# Altium project EKG.PrjPcb
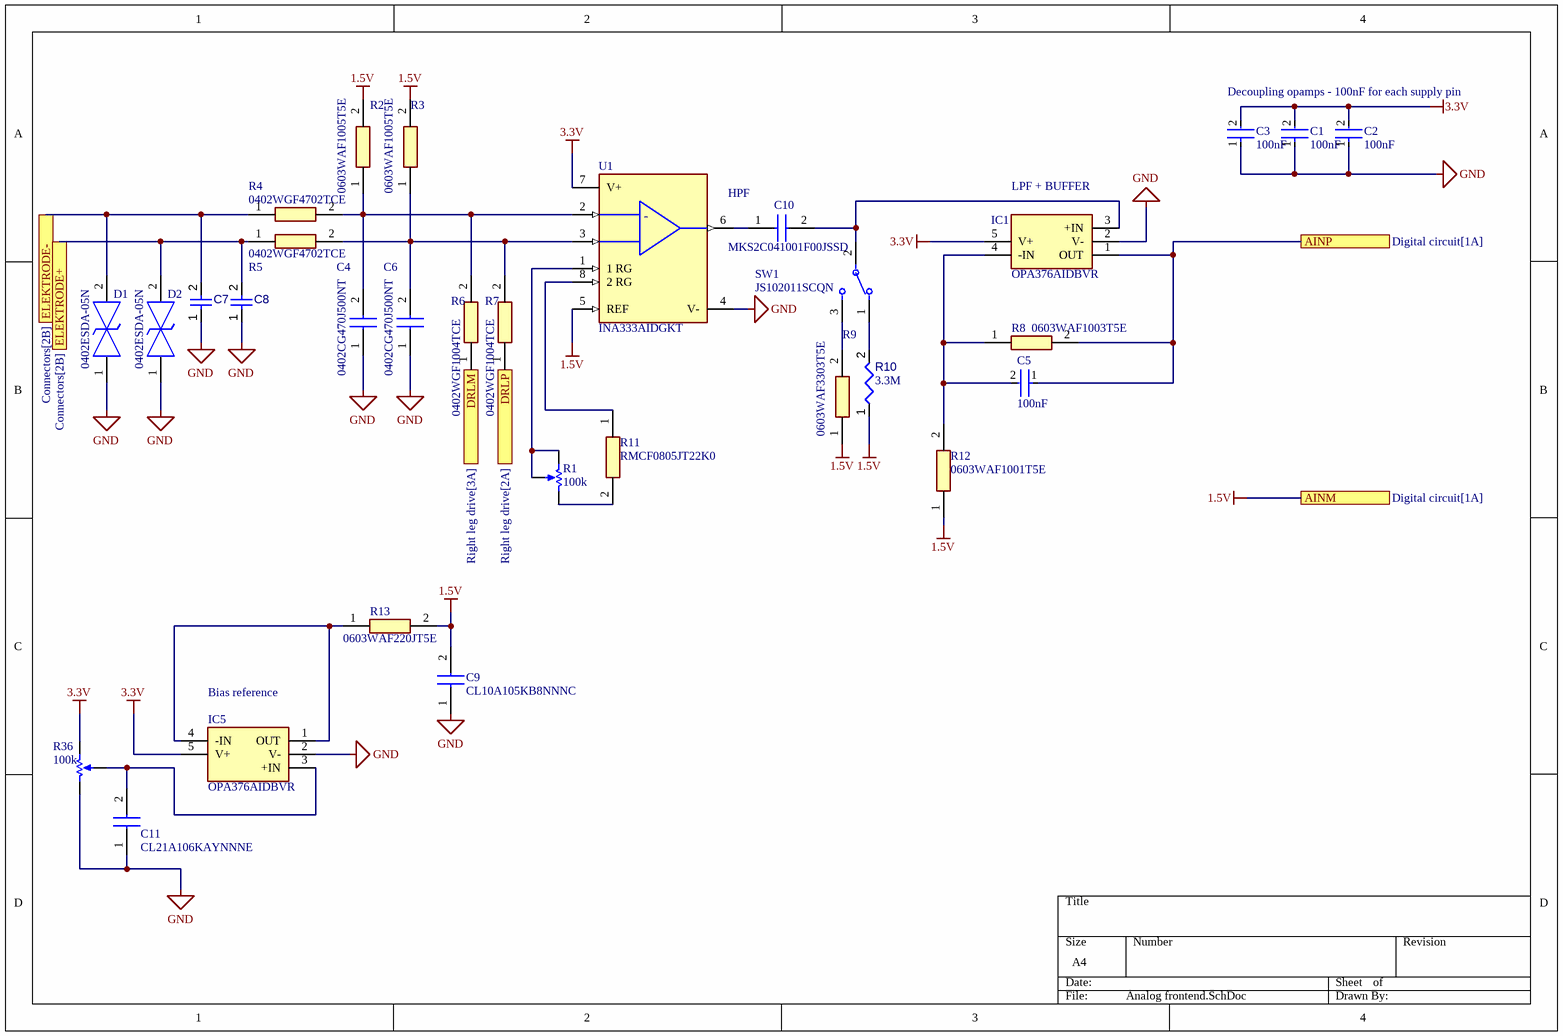
[diagram p0: Analog frontend.SchDoc]
5 sheets, 78 parts. Net scope: flat (ports and power ports of the same name join across sheets).
Board file: PCB.PcbDoc
Sheets:
  Analog frontend.SchDoc
  Digital circuit.SchDoc
  Power supply.SchDoc
  Right leg drive.SchDoc
  Connectors.SchDoc

## Sheet Analog frontend.SchDoc: Analog ECG Frontend
size A4; SheetNumber: 1; SheetTotal: 5

### Parts
C1  value 100nF  [FP-CC0603-DA-IPC_B]  (hidden comment: CC0603KRX7R9BB104)
C2  value 100nF  [FP-CC0603-DA-IPC_B]  (hidden comment: CC0603KRX7R9BB104)
C3  value 100nF  [FP-CC0603-DA-IPC_B]  (hidden comment: CC0603KRX7R9BB104)
C4  0402CG470J500NT  [CAPC1005X55N]
C5  value 100nF  [FP-CC0603-DA-IPC_B]  (hidden comment: CC0603KRX7R9BB104)
C6  0402CG470J500NT  [CAPC1005X55N]
C7  TCC0402COG220J500AT  [TCC0402COG220J500AT]  (value not drawn)
C8  TCC0402COG220J500AT  [TCC0402COG220J500AT]  (value not drawn)
C9  CL10A105KB8NNNC  [CAPC1608X90N]
C10  MKS2C041001F00JSSD  [MKS2C041001F00JSSD]
C11  CL21A106KAYNNNE  [CAPC2012X145N]
D1  0402ESDA-05N  [DIONC1005X60N]
D2  0402ESDA-05N  [DIONC1005X60N]
IC1  OPA376AIDBVR  [SOT95P280X145-5N]
IC5  OPA376AIDBVR  [SOT95P280X145-5N]
R1  value 100k  [BOUR-3266W-3_V]  (hidden comment: 3266W-1-104LF)
R2  0603WAF1005T5E  [RESC1608X55N]
R3  0603WAF1005T5E  [RESC1608X55N]
R4  0402WGF4702TCE  [RESC1005X40N]
R5  0402WGF4702TCE  [RESC1005X40N]
R6  0402WGF1004TCE  [RESC1005X40N]
R7  0402WGF1004TCE  [RESC1005X40N]
R8  0603WAF1003T5E  [RESC1608X55N]
R9  0603WAF3303T5E  [RESC1608X55N]
R10  value 3.3M  [0603WAF3304T5E]  (hidden comment: 0603WAF3304T5E)
R11  RMCF0805JT22K0  [RESC2012X65N]
R12  0603WAF1001T5E  [RESC1608X55N]
R13  0603WAF220JT5E  [RESC1608X55N]
R36  value 100k  [BOUR-3266W-3_V]  (hidden comment: 3266W-1-104LF)
SW1  JS102011SCQN  [FP-JS102011SCQN-MFG]
U1  INA333AIDGKT  [FP-DGK0008A-IPC_B]

### Ports
AINM (see Digital circuit[1A]), AINP (see Digital circuit[1A]), DRLM (see Right leg drive[3A]), DRLP (see Right leg drive[2A]), ELEKTRODE+ (see Connectors[2B]), ELEKTRODE- (see Connectors[2B])

### Nets
1.5V: C9.2 R2.2 R3.2 R9.1 R10.1 R12.1 R13.2 U1.5(REF) ; port AINM
3.3V: C1.2 C2.2 C3.2 IC1.5(V+) IC5.5(V+) R36.1(CCW) U1.7(V+)
GND: C1.1 C2.1 C3.1 C4.1 C6.1 C7.1 C8.1 C9.1 C11.1 D1.1 D2.1 IC1.2(V-) IC5.2(V-) R36.3(CW) U1.4(V-)
NetC4_2: C4.2 R2.1 R4.2 R6.2 U1.2(VIN-)
NetC5_1: C5.1 IC1.1(OUT) R8.2 ; port AINP
NetC5_2: C5.2 IC1.4(-IN) R8.1 R12.2
NetC6_2: C6.2 R3.1 R5.2 R7.2 U1.3(VIN+)
NetC7_2: C7.2 D1.2 R4.1 ; port ELEKTRODE-
NetC8_2: C8.2 D2.2 R5.1 ; port ELEKTRODE+
NetC10_1: C10.1 U1.6(VOUT)
NetC10_2: C10.2 IC1.3(+IN) SW1.2(C)
NetC11_2: C11.2 IC5.3(+IN) R36.2(WIPER)
NetIC2_3: R7.1 ; port DRLP
NetIC3_3: R6.1 ; port DRLM
NetIC5_1: IC5.1(OUT) IC5.4(-IN) R13.1
NetR1_1: R1.1(CCW) R11.2
NetR1_2: R1.2(WIPER) R1.3(CW) U1.1(1_RG)
NetR9_2: R9.2 SW1.3
NetR10_2: R10.2 SW1.1
NetR11_1: R11.1 U1.8(2_RG)

### Notes on the sheet
- Decoupling opamps - 100nF for each supply pin
- (near U1) HPF
- (near IC1) LPF + BUFFER
- (near IC5) Bias reference
- (in symbol CMP-014-00006-1) -

### Library data of the parts
C1-C3 C5 = CMP-001-00148-1: Multilayer Ceramic Capacitor, CC Series, 0.1 - F, - 10%, X7R, 50 V, 0603 [1608 Metric]; Voltage Rating: 50V; Mounting Technology: Surface Mount; Tolerance: 10%; Case/Package: 0603; Max Operating Temperature: 125°C; Min Operating Temperature: -55°C; Pins: 2; Lead Free: Lead Free; Case Code (Metric): 1608; Width: 800µm; Termination: SMD/SMT; Depth: 800µm; RoHS: Compliant; Material: Ceramic; Dielectric: X7R; Schedule B: 8532240020, 8532240020; Country of Origin: Mainland China, Taiwan; Lifecycle Status: Production; Radiation Hardening: No; Case Code (Imperial): 0603; Height: 800µm; Number of Terminals: 2; China RoHS: Compliant; Voltage Rating (DC): 50V; Export Control Classification Number (ECCN) Code: EAR99; Halogen Free: Halogen Free; Thickness: 889µm; Voltage: 50V; Length: 1.6mm; Harmonized Tariff Schedule (HTS) Code: 8532.24.00.20; REACH SVHC: Unaffected; Introduction Date: 2005-08-18; Dielectric Material: Ceramic
C4 C6 = 0402CG470J500NT: Capacitor; Manufacturer_Name: Guangdong Fenghua Advanced Tech; Datasheet Link: https://datasheet.lcsc.com/szlcsc/Guangdong-Fenghua-Advanced-Tech-0402CG470J500NT_C1567.pdf; Height: 0.55mm; Manufacturer_Part_Number: 0402CG470J500NT
C7 C8 = CMP-001-00152-1: 50V 22pF C0G ±5% 0402 Multilayer Ceramic Capacitors MLCC - SMD/SMT ROHS
C9 = CL10A105KB8NNNC: Capacitor; Manufacturer_Name: SAMSUNG; Datasheet Link: https://datasheet.datasheetarchive.com/originals/distributors/Datasheets-DGA10/2411562.pdf; Height: 0.9mm; Manufacturer_Part_Number: CL10A105KB8NNNC; Mouser Part Number: 187-CL10A105KB8NNNC; Mouser Price/Stock: https://www.mouser.co.uk/ProductDetail/Samsung-Electro-Mechanics/CL10A105KB8NNNC?qs=ktYoCbbtCSJz4pFCLWXd5g%3D%3D; Arrow Part Number: CL10A105KB8NNNC; Arrow Price/Stock: https://www.arrow.com/en/products/cl10a105kb8nnnc/samsung-electro-mechanics.html?utm_currency=USD&region=nac
C10 = MKS2C041001F00JSSD: Capacitor; Manufacturer_Name: WIMA; Datasheet Link: https://www.digikey.com/en/products/detail/wima/MKS2C041001F00JSSD/19251598; Height: 10mm; Manufacturer_Part_Number: MKS2C041001F00JSSD; Mouser Part Number: 505-MKS21.0/63/5; Mouser Price/Stock: https://www.mouser.co.uk/ProductDetail/WIMA/MKS2C041001F00JSSD?qs=ISKKXg98%252B1lQgUuGZjf9mQ%3D%3D; Arrow Part Number: MKS2C041001F00JSSD; Arrow Price/Stock: https://www.arrow.com/en/products/mks2c041001f00jssd/wima?region=europe
C11 = CL21A106KAYNNNE: Capacitor; Manufacturer_Name: SAMSUNG; Datasheet Link: https://datasheet.datasheetarchive.com/originals/distributors/Datasheets_SAMA/6a45835c9b7400e9b49c55c38a8ff4a2.pdf; Height: 1.45mm; Manufacturer_Part_Number: CL21A106KAYNNNE; Mouser Part Number: 187-CL21A106KAYNNNE; Mouser Price/Stock: https://www.mouser.co.uk/ProductDetail/Samsung-Electro-Mechanics/CL21A106KAYNNNE?qs=yOVawPpwOwmTXAd4dJtNjA%3D%3D; Arrow Part Number: CL21A106KAYNNNE; Arrow Price/Stock: https://www.arrow.com/en/products/cl21a106kaynnne/samsung-electro-mechanics.html?utm_currency=USD&region=nac
D1 D2 = 0402ESDA-05N: TVS Diode (Bi-directional); Manufacturer_Name: Bourne Semicon; Datasheet Link: https://datasheet.lcsc.com/szlcsc/1811061308_Bourne-Semicon-Shenzhen-0402ESDA-05N_C316049.pdf; Height: 0.6mm; Manufacturer_Part_Number: 0402ESDA-05N
IC1 IC5 = OPA376AIDBVR: Integrated Circuit; Manufacturer_Name: Texas Instruments; Datasheet Link: http://www.ti.com/lit/gpn/OPA376; Height: 1.45mm; Manufacturer_Part_Number: OPA376AIDBVR; Mouser Part Number: 595-OPA376AIDBVR; Mouser Price/Stock: https://www.mouser.co.uk/ProductDetail/Texas-Instruments/OPA376AIDBVR?qs=xL7PkI2RoJ57GVtJklM7uw%3D%3D; Arrow Part Number: OPA376AIDBVR; Arrow Price/Stock: https://www.arrow.com/en/products/opa376aidbvr/texas-instruments.html?utm_currency=USD&region=europe
R1 R36 = CMP-009-00233-1: Trimmer, Cermet, Rest 100 Kilohms, Pcb, Pwr-rtg 0.25W, Dim 0.264INLX0.177INWX0.285INH; Insulation Resistance: 1GΩ; Lead Length: 4.88mm; Lead Diameter: 460µm; Voltage Rating: 300V; Max Power Dissipation: 250mW; Pitch: 2.54mm; Number of Turns: 12; Tolerance: 10%; Temperature Coefficient: 100ppm/°C; Composition: Cermet; Number of Terminals: 3; Military Standard: Not; REACH SVHC: Affected; Thickness: 5.59mm; Taper: Linear; Max Operating Temperature: 125°C; Contact Plating: Tin; Depth: 4.5mm; RoHS: Compliant; Min Operating Temperature: -55°C; Pins: 3; Termination: Pin; Height: 7.24mm; Schedule B: 8533400080, 8533400080; Working Voltage: 300V; Voltage Rating (AC): 300V; Voltage Rating (DC): 300V; Width: 4.5mm; Radiation Hardening: No; Lifecycle Status: Production; Weight: 425.242847mg; Type: Potentiometer; Color: Blue; Length: 6.71mm; Power Rating: 250mW
R2 R3 = 0603WAF1005T5E: Resistor; Manufacturer_Name: ROYALOHM; Datasheet Link: https://eu.mouser.com/datasheet/3/5925/1/1.pdf; Height: 0.55mm; Manufacturer_Part_Number: 0603WAF1005T5E; Mouser Part Number: 303-0603WAF1005T5E; Mouser Price/Stock: https://www.mouser.co.uk/ProductDetail/Royalohm/0603WAF1005T5E?qs=e8oIoAS2J1TtIpBlPWLC5w%3D%3D
R4 R5 = 0402WGF4702TCE: Resistor; Manufacturer_Name: UNI-ROYAL(Uniroyal Elec); Datasheet Link: https://datasheet.lcsc.com/szlcsc/Uniroyal-Elec-0402WGF4702TCE_C25792.pdf; Height: 0.4mm; Manufacturer_Part_Number: 0402WGF4702TCE
R6 R7 = 0402WGF1004TCE: Resistor; Manufacturer_Name: ROYALOHM; Datasheet Link: https://www.mouser.ca/datasheet/2/1365/1-3044649.pdf; Height: 0.4mm; Manufacturer_Part_Number: 0402WGF1004TCE; Mouser Part Number: 303-0402WGF1004TCE; Mouser Price/Stock: https://www.mouser.co.uk/ProductDetail/Royalohm/0402WGF1004TCE?qs=e8oIoAS2J1Sm8qYhjADD%252Bg%3D%3D
R8 = 0603WAF1003T5E: Resistor; Manufacturer_Name: UNI-ROYAL(Uniroyal Elec); Datasheet Link: https://datasheet.lcsc.com/szlcsc/Uniroyal-Elec-0603WAF1003T5E_C25803.pdf; Height: 0.55mm; Manufacturer_Part_Number: 0603WAF1003T5E
R9 = 0603WAF3303T5E: Resistor; Manufacturer_Name: Uniroyal Elec; Datasheet Link: https://datasheet.lcsc.com/szlcsc/Uniroyal-Elec-0603WAF3303T5E_C23137.pdf; Height: 0.55mm; Manufacturer_Part_Number: 0603WAF3303T5E
R10 = CMP-009-00239-1: Res Thick Film 0603 3.3M Ohm 1% 0.1W(1/10W) ±100ppm/C Pad SMD T/R; Working Voltage: 75V; Power Rating: 100mW; Temperature Coefficient: 100ppm/°C; Lifecycle Status: Production; REACH SVHC: Unaffected; Case/Package: 0603; Number of Terminals: 2; Mounting Technology: Surface Mount; Width: 800µm; RoHS: Compliant; China RoHS: Non-Compliant; Length: 1.6mm; Tolerance: 1%; Max Operating Temperature: 155°C; Height: 450µm; Min Operating Temperature: -55°C
R11 = RMCF0805JT22K0: Resistor; Manufacturer_Name: Stackpole Electronics; Datasheet Link: https://cs.seielect.com/catalog/SEI-RMCF_RMCP.pdf; Height: 0.65mm; Manufacturer_Part_Number: RMCF0805JT22K0; Mouser Part Number: 708-RMCF0805JT22K0; Mouser Price/Stock: https://www.mouser.co.uk/ProductDetail/SEI-Stackpole/RMCF0805JT22K0?qs=FESYatJ8odJj8AR7KQYlug%3D%3D; Arrow Part Number: RMCF0805JT22K0; Arrow Price/Stock: https://www.arrow.com/en/products/rmcf0805jt22k0/stackpole-electronics?region=nac
R12 = 0603WAF1001T5E: Resistor; Manufacturer_Name: UNI-ROYAL(Uniroyal Elec); Datasheet Link: https://datasheet.lcsc.com/szlcsc/Uniroyal-Elec-0603WAF1001T5E_C21190.pdf; Height: 0.55mm; Manufacturer_Part_Number: 0603WAF1001T5E
R13 = 0603WAF220JT5E: Resistor; Manufacturer_Name: UNI-ROYAL(Uniroyal Elec); Datasheet Link: https://www.lcsc.com/datasheet/lcsc_datasheet_2206010100_UNI-ROYAL-Uniroyal-Elec-0603WAF220JT5E_C23345.pdf; Height: 0.55mm; Manufacturer_Part_Number: 0603WAF220JT5E
SW1 = CMP-011-00018-1: Slide Switch, 2 Positions, SPDT, Latched, 0.3A, 6VDC, Solder Terminal, Surface Mount-straight; Contact Resistance: 70mΩ; Number of Positions: 1; Actuator Length: 2.0066mm; Switch Travel: 2mm; Electrical Life: 5kcycles; Current Rating: 300mA; Actuator Material: Nylon; Switch Function: On-On; Insulation Resistance: 100MΩ; Voltage Rating (DC): 6V; Min Operating Temperature: -40°C; Radiation Hardening: No; Orientation: Straight; Throw Configuration: SPDT; Introduction Date: 2009-12-16; Housing Material: Nylon; Length: 8.5mm; Harmonized Tariff Schedule (HTS) Code: 8536.50.90.50; Country of Origin: Mainland China; Color: Black; Export Control Classification Number (ECCN) Code: EAR99; REACH SVHC: Unaffected; Case/Package: SMD/SMT; Contact Current Rating: 300mA; Contact Plating: Silver; Life (Cycles): 5kcycles; Packaging: Tape and Reel; Mounting Technology: Surface Mount; Termination: Solder; RoHS: Compliant; Max Current Rating: 300mA; Height: 3.5mm; Terminal Material: Brass; Max Voltage Rating (DC): 6V; Max Operating Temperature: 85°C; Lifecycle Status: Production; Depth: 7.5mm
U1 = CMP-014-00006-1: IC INST AMP 1 CIRCUIT 8VSSOP Instrumentation Amplifier 1 Circuit Rail-to-Rail 8-VSSOP; Manufacturer Lifecycle Status: ACTIVE; Number of Amplifiers: 1; Operating Supply Current: 50µA; Max Junction Temperature (Tj): 150°C; Common Mode Rejection Ratio: 100dB; Max Dual Supply Voltage: 2.75V; Min Supply Voltage: 1.8V; Max Supply Voltage: 5.5V; Min Dual Supply Voltage: 900mV; Input Offset Voltage (Vos): 25µV; Output Current per Channel: 40mA; Gain Bandwidth Product: 150kHz; Max Supply Current: 75µA; Value: 100GΩ; Power Supply Rejection Ratio (PSRR): 120dB; Number of Elements: 3; Input Bias Current: 70pA; Slew Rate: 0.16V/µs; Voltage Gain: 60dB; Thickness: 970µm; Width: 3mm; Number of Circuits: 1; Quiescent Current: 50µA; Lead Free: Lead Free; Height: 0m; Max Operating Temperature: 125°C; REACH SVHC: Unaffected; Schedule B: 8542330000, 8542330000; Radiation Hardening: No; Length: 3mm; RoHS: Compliant; Number of Channels: 1; -3db Bandwidth: 150kHz; Nominal Supply Current: 50µA; Case/Package: VSSOP; Ambient Temperature Range High: 125°C; Bandwidth: 150kHz; Lifecycle Status: Production; Pins: 8; Min Operating Temperature: -40°C; Weight: 26.506804mg

## Sheet Digital circuit.SchDoc
size A; SheetNumber: 2; SheetTotal: 5
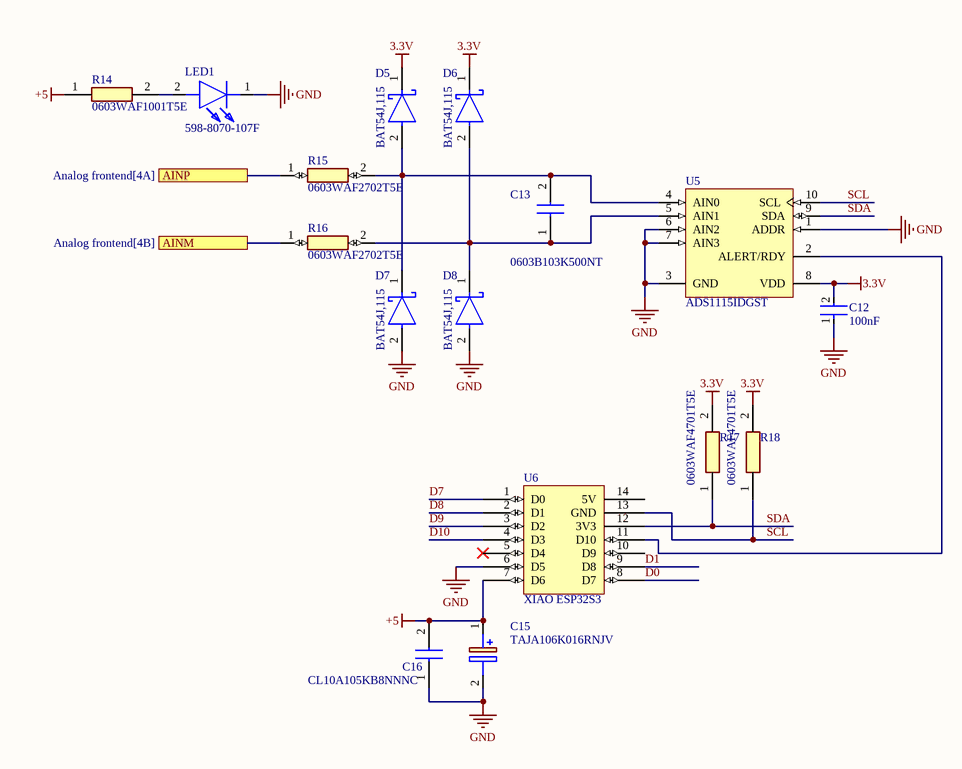
[diagram p1: Digital circuit.SchDoc]

### Parts
C12  value 100nF  [FP-CC0603-DA-IPC_B]  (hidden comment: CC0603KRX7R9BB104)
C13  0603B103K500NT  [CAPC1608X90N]
C15  TAJA106K016RNJV  [CAPPM3216X180N]
C16  CL10A105KB8NNNC  [CAPC1608X90N]
D5  BAT54J,115  [FP-SOD323F-MFG]
D6  BAT54J,115  [FP-SOD323F-MFG]
D7  BAT54J,115  [FP-SOD323F-MFG]
D8  BAT54J,115  [FP-SOD323F-MFG]
LED1  598-8070-107F  [5988070107F]
R14  0603WAF1001T5E  [RESC1608X55N]
R15  0603WAF2702T5E  [RESC1608X55N]
R16  0603WAF2702T5E  [RESC1608X55N]
R17  0603WAF4701T5E  [RESC1608X55N]
R18  0603WAF4701T5E  [RESC1608X55N]
U5  ADS1115IDGST  [TI-DGS10_L]
U6  XIAO ESP32S3  [XIAO ESP32S3-Footprint-1]

### Ports
AINM (see Analog frontend[4B]), AINP (see Analog frontend[4A])

### Nets
1.5V: R16.1 ; port AINM
3.3V: C12.2 D5.1(C) D6.1(C) R17.2 R18.2 U5.8(VDD)
+5: C15.1(+) C16.2 R14.1 U6.7(D6)
GND: C12.1 C15.2(-) C16.1 D7.2(A) D8.2(A) LED1.1(K) U5.1(ADDR) U5.3(GND) U5.6(AIN2) U5.7(AIN3) U6.6(D5)
D0: U6.8(D7)
D1: U6.9(D8)
D7: U6.1(D0)
D8: U6.2(D1)
D9: U6.3(D2)
D10: U6.4(D3)
SCL: R18.1 U5.10(SCL) U6.13(GND)
SDA: R17.1 U5.9(SDA) U6.12(3V3)
NetC5_1: R15.1 ; port AINP
NetC13_1: C13.1 D6.2(A) D8.1(C) R16.2 U5.5(AIN1)
NetC13_2: C13.2 D5.2(A) D7.1(C) R15.2 U5.4(AIN0)
NetLED1_2: LED1.2(A) R14.2
NetU5_2: U5.2(ALERT/RDY) U6.11(D10)

Not connected (* = marked no-connect by the designer): U6 5(D4)* 10(D9) 14(5V)

### Library data of the parts
C12 = CMP-001-00148-1: as C1 on sheet Analog frontend; Mounting Technology: Surface Mount; Tolerance: 10%; Case/Package: 0603; Max Operating Temperature: 125°C; Min Operating Temperature: -55°C; Pins: 2; Lead Free: Lead Free; Case Code (Metric): 1608; Width: 800µm; Termination: SMD/SMT; Depth: 800µm; RoHS: Compliant; Material: Ceramic; Dielectric: X7R; Schedule B: 8532240020, 8532240020; Country of Origin: Mainland China, Taiwan; Lifecycle Status: Production; Radiation Hardening: No; Case Code (Imperial): 0603; Height: 800µm; Number of Terminals: 2; China RoHS: Compliant; Voltage Rating (DC): 50V; Export Control Classification Number (ECCN) Code: EAR99; Halogen Free: Halogen Free; Thickness: 889µm; Voltage: 50V; Length: 1.6mm; Harmonized Tariff Schedule (HTS) Code: 8532.24.00.20; REACH SVHC: Unaffected; Introduction Date: 2005-08-18; Dielectric Material: Ceramic
C13 = 0603B103K500NT: Capacitor; Manufacturer_Name: Fenghua Advanced Technology (Holding) CO.; Datasheet Link: https://www.datasheets360.com/pdf/5043620394403009653; Height: 0.9mm; Manufacturer_Part_Number: 0603B103K500NT
C15 = TAJA106K016RNJV: Capacitor Polarised; Manufacturer_Name: Kyocera AVX; Datasheet Link: http://www.farnell.com/datasheets/1680476.pdf; Height: 1.8mm; Manufacturer_Part_Number: TAJA106K016RNJV; Mouser Part Number: 581-TAJA106K016RNJV; Mouser Price/Stock: https://www.mouser.co.uk/ProductDetail/KYOCERA-AVX/TAJA106K016RNJV?qs=X421pCAdHWe2u1fVMeO6XQ%3D%3D; Arrow Part Number: TAJA106K016RNJV; Arrow Price/Stock: https://www.arrow.com/en/products/taja106k016rnjv/avx?utm_currency=USD&region=nac
C16 = CL10A105KB8NNNC: Capacitor; Manufacturer_Name: SAMSUNG; Datasheet Link: https://datasheet.datasheetarchive.com/originals/distributors/Datasheets-DGA10/2411562.pdf; Height: 0.9mm; Manufacturer_Part_Number: CL10A105KB8NNNC; Mouser Part Number: 187-CL10A105KB8NNNC; Mouser Price/Stock: https://www.mouser.co.uk/ProductDetail/Samsung-Electro-Mechanics/CL10A105KB8NNNC?qs=ktYoCbbtCSJz4pFCLWXd5g%3D%3D; Arrow Part Number: CL10A105KB8NNNC; Arrow Price/Stock: https://www.arrow.com/en/products/cl10a105kb8nnnc/samsung-electro-mechanics.html?utm_currency=USD&region=nac
D5-D8 = CMP-004-00052-1: BAT54 Series 30 V 0.2 A Surfacec Mount Schottky Diode - SOD-323F; Manufacturer Lifecycle Status: RELEASED FOR SUPPLY; Max Reverse Voltage (DC): 30V; Max Output current: 200mA; Max Power Dissipation: 550mW; Forward Voltage: 240mV; Peak Non-Repetitive Surge Current: 600mA; Element Configuration: Single; Reverse Standoff Voltage: 25V; Value: 10pF; Max Junction Temperature (Tj): 150°C; Max Reverse Leakage Current: 2µA; Number of Elements: 1; RoHS: Compliant; Lead Free: Lead Free; Export Control Classification Number (ECCN) Code: EAR99; Forward Current: 200mA; Height: 800µm; REACH SVHC: Yes; Reverse Voltage: 30V; Max Repetitive Reverse Voltage (Vrrm): 30V; Radiation Hardening: No; Pins: 2; Max Surge Current: 600mA; Schedule B: 8541100070, 8541100070; Contact Plating: Tin; Mounting Technology: Surface Mount; Harmonized Tariff Schedule (HTS) Code: 8541.10.00.70; Peak Reverse Current: 2µA; Lifecycle Status: Production; China RoHS: Compliant; Average Rectified Current: 200mA; Ambient Temperature Range High: 150°C; Number of Terminals: 2; Max Operating Temperature: 150°C; Max Forward Surge Current (Ifsm): 600mA; Introduction Date: 2007-03-09; Country of Origin: Mainland China, Malaysia; Min Operating Temperature: -65°C
LED1 = 598-8070-107F: LED; Manufacturer_Name: Dialight; Datasheet Link: https://www.mouser.in/datasheet/2/109/Dialight_CBI_data_598_0603_Apr2018-2944350.pdf; Height: 0.8mm; Manufacturer_Part_Number: 598-8070-107F; Mouser Part Number: 645-598-8070-107F; Mouser Price/Stock: https://www.mouser.co.uk/ProductDetail/Dialight/598-8070-107F?qs=7JStj%2FjQ2SEP6f6GzqcocA%3D%3D; Arrow Part Number: 598-8070-107F; Arrow Price/Stock: https://www.arrow.com/en/products/598-8070-107f/dialight?region=nac
R14 = 0603WAF1001T5E: as R12 on sheet Analog frontend; Datasheet Link: https://datasheet.lcsc.com/szlcsc/Uniroyal-Elec-0603WAF1001T5E_C21190.pdf; Height: 0.55mm; Manufacturer_Part_Number: 0603WAF1001T5E
R15 R16 = 0603WAF2702T5E: Resistor; Manufacturer_Name: UNI-ROYAL(Uniroyal Elec); Datasheet Link: https://datasheet.lcsc.com/lcsc/2110252130_UNI-ROYAL-Uniroyal-Elec-0603WAF2702T5E_C22967.pdf; Height: 0.55mm; Manufacturer_Part_Number: 0603WAF2702T5E
R17 R18 = 0603WAF4701T5E: Resistor; Manufacturer_Name: UNI-ROYAL(Uniroyal Elec); Datasheet Link: https://datasheet.lcsc.com/szlcsc/Uniroyal-Elec-0603WAF4701T5E_C23162.pdf; Height: 0.55mm; Manufacturer_Part_Number: 0603WAF4701T5E
U5 = CMP-014-00008-1: 4-Channel Single ADC Delta-Sigma 860sps 16-bit Serial 10-Pin VSSOP T/R; Manufacturer Lifecycle Status: ACTIVE; Min Supply Voltage: 2V; Resolution: 2B; Number of A/D Converters: 1; Max Power Dissipation: 500µW; Nominal Supply Current: 150µA; Polarity: Bipolar; Max Supply Voltage: 5.5V; Interface: I2C; Power Dissipation: 900µW; Number of Bits: 16; Number of Channels: 4; Operating Supply Voltage: 3.3V; Integral Nonlinearity (INL): 1LSB; Termination: SMD/SMT; Case/Package: VSSOP; Width: 3mm; Contact Plating: Gold; REACH SVHC: No; Pins: 10; Number of Converters: 1; Max Operating Temperature: 125°C; Thickness: 1.02mm; Lead Free: Lead Free; Number of Elements: 1; Height: 1.07mm; Min Supply Voltage (DC): 2V; Lifecycle Status: Production; RoHS: Compliant; Conversion Rate: 860sps; Schedule B: 8542390000, 8542390000; Radiation Hardening: No; Supply Type: Single; Number of Inputs: 4; Sampling Rate: 860sps; Length: 3mm; Min Operating Temperature: -40°C; Max Supply Voltage (DC): 5.5V
U6 = CMP-020-00029-1

## Sheet Power supply.SchDoc
size A; SheetNumber: 3; SheetTotal: 5
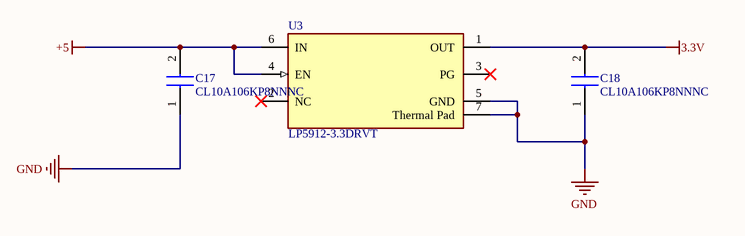
[diagram p2: Power supply.SchDoc]

### Parts
C17  CL10A106KP8NNNC  [CAPC1608X90N]
C18  CL10A106KP8NNNC  [CAPC1608X90N]
U3  LP5912-3.3DRVT  [FP-DRV0006A-IPC_C]

### Nets
3.3V: C18.2 U3.1(OUT)
+5: C17.2 U3.4(EN) U3.6(IN)
GND: C17.1 C18.1 U3.5(GND) U3.7(Thermal_Pad)

Not connected (* = marked no-connect by the designer): U3 2(NC)* 3(PG)*

### Library data of the parts
C17 C18 = CL10A106KP8NNNC: Capacitor; Manufacturer_Name: SAMSUNG; Datasheet Link: https://datasheet.datasheetarchive.com/originals/distributors/Datasheets-DGA10/2415998.pdf; Height: 0.9mm; Manufacturer_Part_Number: CL10A106KP8NNNC; Mouser Part Number: 187-CL10A106KP8NNNC; Mouser Price/Stock: https://www.mouser.co.uk/ProductDetail/Samsung-Electro-Mechanics/CL10A106KP8NNNC?qs=X6jEic%2FHinAlyfRHj7fKwg%3D%3D; Arrow Part Number: CL10A106KP8NNNC; Arrow Price/Stock: https://www.arrow.com/en/products/cl10a106kp8nnnc/samsung-electro-mechanics.html?utm_currency=USD&region=europe
U3 = CMP-019-00055-1: 500mA 40dB@(100kHz) Fixed 3.3V Positive 6.5V DFN-6(2x2) Linear Voltage Regulators (LDO) ROHS; Manufacturer Lifecycle Status: ACTIVE; Dropout Voltage: 950mV; Number of Regulators: 1; Quiescent Current: 30µA; Height: 800µm; Packaging: Cut Tape; Mounting Technology: Surface Mount; Output Voltage: 3.3V; Output Type: Fixed; Length: 2mm; Lead Free: Lead Free; Thickness: 750µm; Output Current: 500mA; Lifecycle Status: Production; Max Operating Temperature: 125°C; RoHS: Compliant; Min Operating Temperature: -40°C; Number of Channels: 1; Pins: 6; Width: 2mm; Schedule B: 8542390000, 8542390000

## Sheet Right leg drive.SchDoc
size A; SheetNumber: 4; SheetTotal: 5
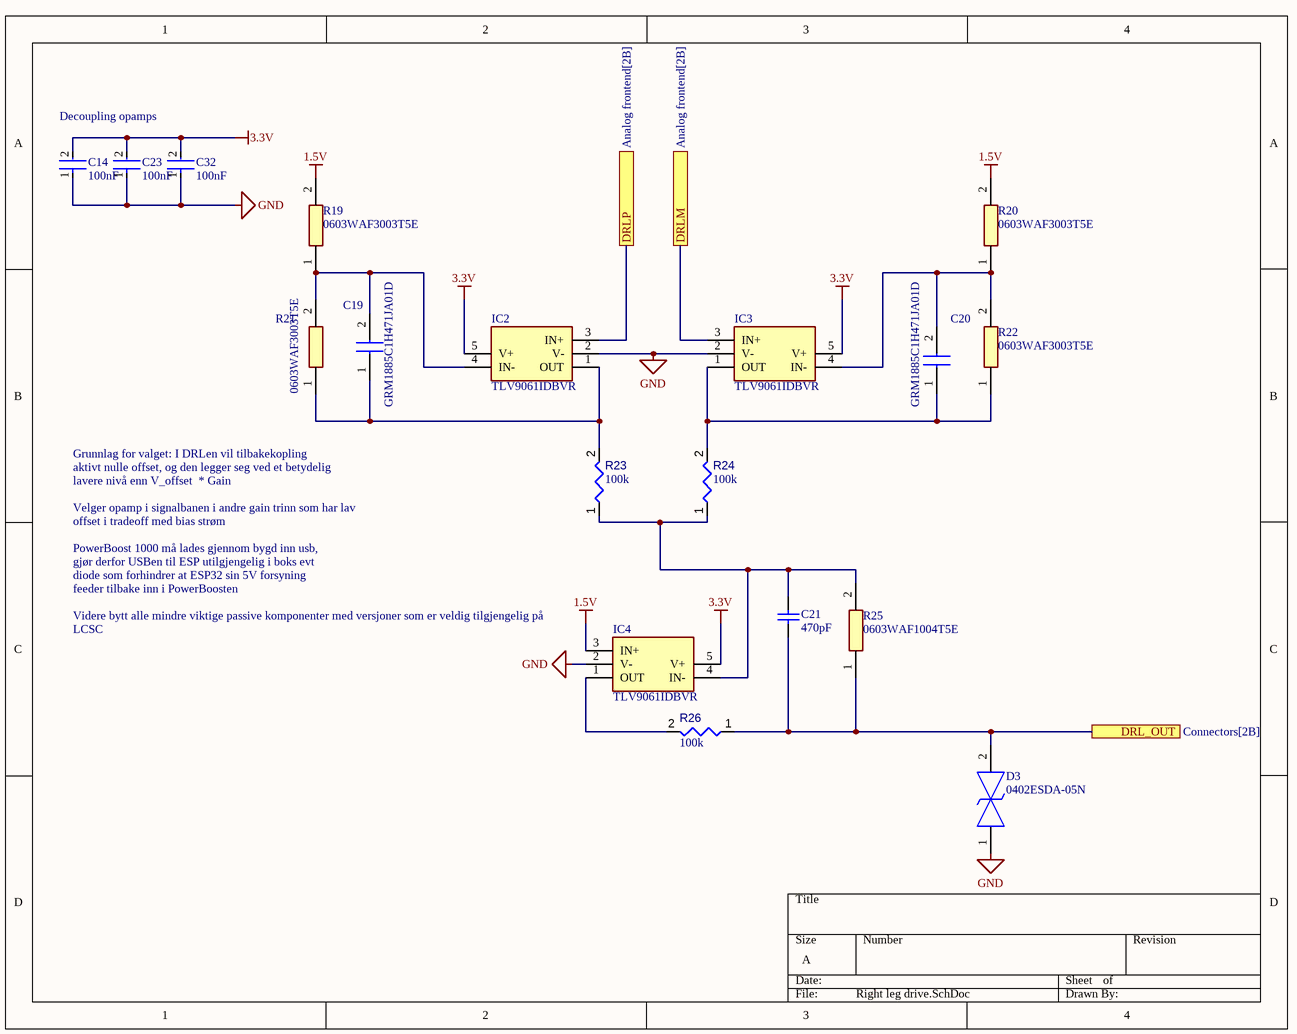
[diagram p3: Right leg drive.SchDoc]

### Parts
C14  value 100nF  [FP-CC0603-DA-IPC_B]  (hidden comment: CC0603KRX7R9BB104)
C19  GRM1885C1H471JA01D  [CAPC1608X90N]
C20  GRM1885C1H471JA01D  [CAPC1608X90N]
C21  value 470pF  [Copy of KGM05DR50J226MH]  (hidden comment: 0402B471K500NT)
C23  value 100nF  [FP-CC0603-DA-IPC_B]  (hidden comment: CC0603KRX7R9BB104)
C32  value 100nF  [FP-CC0603-DA-IPC_B]  (hidden comment: CC0603KRX7R9BB104)
D3  0402ESDA-05N  [DIONC1005X60N]
IC2  TLV9061IDBVR  [SOT95P280X145-5N]
IC3  TLV9061IDBVR  [SOT95P280X145-5N]
IC4  TLV9061IDBVR  [SOT95P280X145-5N]
R19  0603WAF3003T5E  [RESC1608X55N]
R20  0603WAF3003T5E  [RESC1608X55N]
R21  0603WAF3003T5E  [RESC1608X55N]
R22  0603WAF3003T5E  [RESC1608X55N]
R23  value 100k  [0603WAF3304T5E]  (hidden comment: 0603WAF1003T5E)
R24  value 100k  [0603WAF3304T5E]  (hidden comment: 0603WAF1003T5E)
R25  0603WAF1004T5E  [RESC1608X55N]
R26  value 100k  [0603WAF3304T5E]  (hidden comment: 0603WAF1003T5E)

### Ports
DRL_OUT (see Connectors[2B]), DRLM (see Analog frontend[2B]), DRLP (see Analog frontend[2B])

### Nets
1.5V: IC4.3(IN+) R19.2 R20.2
3.3V: C14.2 C23.2 C32.2 IC2.5(V+) IC3.5(V+) IC4.5(V+)
GND: C14.1 C23.1 C32.1 D3.1 IC2.2(V-) IC3.2(V-) IC4.2(V-)
NetC19_1: C19.1 IC2.1(OUT) R21.1 R23.2
NetC19_2: C19.2 IC2.4(IN-) R19.1 R21.2
NetC20_1: C20.1 IC3.1(OUT) R22.1 R24.2
NetC20_2: C20.2 IC3.4(IN-) R20.1 R22.2
NetC21_1: C21.1 D3.2 R25.1 R26.1 ; port DRL_OUT
NetC21_2: C21.2 IC4.4(IN-) R23.1 R24.1 R25.2
NetIC2_3: IC2.3(IN+) ; port DRLP
NetIC3_3: IC3.3(IN+) ; port DRLM
NetIC4_1: IC4.1(OUT) R26.2

### Notes on the sheet
- Decoupling opamps
- Grunnlag for valget: I DRLen vil tilbakekopling
- aktivt nulle offset, og den legger seg ved et betydelig
- lavere nivå enn V_offset  * Gain
- Velger opamp i signalbanen i andre gain trinn som har lav
- offset i tradeoff med bias strøm
- PowerBoost 1000 må lades gjennom bygd inn usb,
- gjør derfor USBen til ESP utilgjengelig i boks evt
- diode som forhindrer at ESP32 sin 5V forsyning
- feeder tilbake inn i PowerBoosten
- (near IC4) Videre bytt alle mindre viktige passive komponenter med versjoner som er veldig tilgjengelig på
- LCSC

### Library data of the parts
C14 C23 C32 = CMP-001-00148-1: as C1 on sheet Analog frontend; Mounting Technology: Surface Mount; Tolerance: 10%; Case/Package: 0603; Max Operating Temperature: 125°C; Min Operating Temperature: -55°C; Pins: 2; Lead Free: Lead Free; Case Code (Metric): 1608; Width: 800µm; Termination: SMD/SMT; Depth: 800µm; RoHS: Compliant; Material: Ceramic; Dielectric: X7R; Schedule B: 8532240020, 8532240020; Country of Origin: Mainland China, Taiwan; Lifecycle Status: Production; Radiation Hardening: No; Case Code (Imperial): 0603; Height: 800µm; Number of Terminals: 2; China RoHS: Compliant; Voltage Rating (DC): 50V; Export Control Classification Number (ECCN) Code: EAR99; Halogen Free: Halogen Free; Thickness: 889µm; Voltage: 50V; Length: 1.6mm; Harmonized Tariff Schedule (HTS) Code: 8532.24.00.20; REACH SVHC: Unaffected; Introduction Date: 2005-08-18; Dielectric Material: Ceramic
C19 C20 = GRM1885C1H471JA01D: Capacitor; Manufacturer_Name: Murata Electronics; Datasheet Link: https://search.murata.co.jp/Ceramy/image/img/A01X/G101/ENG/GRM1885C1H471JA01-01A.pdf; Height: 0.9mm; Manufacturer_Part_Number: GRM1885C1H471JA01D; Mouser Part Number: 81-GRM39C471J50; Mouser Price/Stock: https://www.mouser.co.uk/ProductDetail/Murata-Electronics/GRM1885C1H471JA01D?qs=dDtGB%252BtNe6pvV5u0%2FOvNVA%3D%3D; Arrow Part Number: GRM1885C1H471JA01D; Arrow Price/Stock: https://www.arrow.com/en/products/grm1885c1h471ja01d/murata-manufacturing.html?utm_currency=USD&region=europe
C21 = CMP-001-00150-3: 50V 470pF X7R ±10% 0402 Multilayer Ceramic Capacitors MLCC - SMD/SMT ROHS; Voltage Rating (DC): 50V; Mounting Technology: Surface Mount; Max Operating Temperature: 125°C; Lifecycle Status: Production; RoHS: Compliant; Dielectric Material: Ceramic; Length: 1mm; Width: 500µm; Case/Package: 0402; Height: 500µm; Number of Terminals: 2; REACH SVHC: Unaffected; Min Operating Temperature: -55°C
D3 = 0402ESDA-05N: as D1 on sheet Analog frontend; Datasheet Link: https://datasheet.lcsc.com/szlcsc/1811061308_Bourne-Semicon-Shenzhen-0402ESDA-05N_C316049.pdf; Height: 0.6mm; Manufacturer_Part_Number: 0402ESDA-05N
IC2-IC4 = TLV9061IDBVR: Integrated Circuit; Manufacturer_Name: Texas Instruments; Datasheet Link: http://www.ti.com/lit/gpn/tlv9061; Height: 1.45mm; Manufacturer_Part_Number: TLV9061IDBVR; Mouser Part Number: 595-TLV9061IDBVR; Mouser Price/Stock: https://www.mouser.co.uk/ProductDetail/Texas-Instruments/TLV9061IDBVR?qs=w%2Fv1CP2dgqpra2GA6pq5aQ%3D%3D; Arrow Part Number: TLV9061IDBVR; Arrow Price/Stock: https://www.arrow.com/en/products/tlv9061idbvr/texas-instruments?utm_currency=USD&region=nac
R19-R22 = 0603WAF3003T5E: Resistor; Manufacturer_Name: ROYALOHM; Datasheet Link: https://www.mouser.de/datasheet/2/1365/1-3044649.pdf; Height: 0.55mm; Manufacturer_Part_Number: 0603WAF3003T5E
R23 R24 R26 = CMP-009-00240-1: Fixed Resistor, Metal Glaze/Thick Film, 0.1W, 100000ohm, 75V, 1% +/-Tol, Surface Mount, 0603; Power Rating: 100mW; Working Voltage: 50V; Temperature Coefficient: 100ppm/°C; Harmonized Tariff Schedule (HTS) Code: 8533.21.00.30; REACH SVHC: Unaffected; Height: 450µm; Lifecycle Status: Production; RoHS: Compliant; Length: 1.6mm; Mounting Technology: Surface Mount; Tolerance: 1%; Width: 800µm; Case/Package: 0603; Min Operating Temperature: -55°C; Max Operating Temperature: 155°C; Export Control Classification Number (ECCN) Code: EAR99; Number of Terminals: 2
R25 = 0603WAF1004T5E: Resistor; Manufacturer_Name: ROYALOHM; Datasheet Link: https://eu.mouser.com/datasheet/3/5925/1/1.pdf; Height: 0.55mm; Manufacturer_Part_Number: 0603WAF1004T5E; Mouser Part Number: 303-0603WAF1004T5E; Mouser Price/Stock: https://www.mouser.co.uk/ProductDetail/Royalohm/0603WAF1004T5E?qs=e8oIoAS2J1ROidUp2W57ZQ%3D%3D

## Sheet Connectors.SchDoc
size A; SheetNumber: 5; SheetTotal: 5
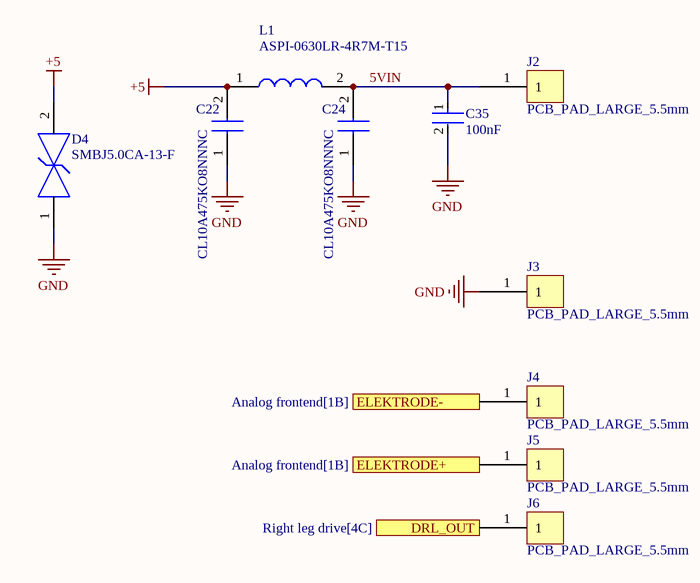
[diagram p4: Connectors.SchDoc]

### Parts
C22  CL10A475KO8NNNC  [CAPC1608X90N]
C24  CL10A475KO8NNNC  [CAPC1608X90N]
C35  value 100nF  [FP-CC0603-DA-IPC_B]  (hidden comment: CC0603KRX7R9BB104)
D4  SMBJ5.0CA-13-F  [FP-SMB-CA-MFG]
J2  PCB_PAD_LARGE_5.5mm  [PCB_MOTOR_PAD-Footprint-1]
J3  PCB_PAD_LARGE_5.5mm  [PCB_MOTOR_PAD-Footprint-1]
J4  PCB_PAD_LARGE_5.5mm  [PCB_MOTOR_PAD-Footprint-1]
J5  PCB_PAD_LARGE_5.5mm  [PCB_MOTOR_PAD-Footprint-1]
J6  PCB_PAD_LARGE_5.5mm  [PCB_MOTOR_PAD-Footprint-1]
L1  ASPI-0630LR-4R7M-T15  [ASPI-0630LR]

### Ports
DRL_OUT (see Right leg drive[4C]), ELEKTRODE+ (see Analog frontend[1B]), ELEKTRODE- (see Analog frontend[1B])

### Nets
+5: C22.2 D4.2 L1.1
GND: C22.1 C24.1 C35.2 D4.1 J3.1
5VIN: C24.2 C35.1 J2.1 L1.2
NetC7_2: J4.1 ; port ELEKTRODE-
NetC8_2: J5.1 ; port ELEKTRODE+
NetC21_1: J6.1 ; port DRL_OUT

### Library data of the parts
C22 C24 = CL10A475KO8NNNC: Capacitor; Manufacturer_Name: SAMSUNG; Datasheet Link: https://rs.componentsearchengine.com/Datasheets/2/CL10A475KO8NNNC.pdf; Height: 0.9mm; Manufacturer_Part_Number: CL10A475KO8NNNC; Mouser Part Number: 187-CL10A475KO8NNNC; Mouser Price/Stock: https://www.mouser.co.uk/ProductDetail/Samsung-Electro-Mechanics/CL10A475KO8NNNC?qs=X6jEic%2FHinAbIjmLnFfqqQ%3D%3D; Arrow Part Number: CL10A475KO8NNNC; Arrow Price/Stock: https://www.arrow.com/en/products/cl10a475ko8nnnc/samsung-electro-mechanics.html?utm_currency=USD&region=nac
C35 = CMP-001-00148-1: as C1 on sheet Analog frontend; Mounting Technology: Surface Mount; Tolerance: 10%; Case/Package: 0603; Max Operating Temperature: 125°C; Min Operating Temperature: -55°C; Pins: 2; Lead Free: Lead Free; Case Code (Metric): 1608; Width: 800µm; Termination: SMD/SMT; Depth: 800µm; RoHS: Compliant; Material: Ceramic; Dielectric: X7R; Schedule B: 8532240020, 8532240020; Country of Origin: Mainland China, Taiwan; Lifecycle Status: Production; Radiation Hardening: No; Case Code (Imperial): 0603; Height: 800µm; Number of Terminals: 2; China RoHS: Compliant; Voltage Rating (DC): 50V; Export Control Classification Number (ECCN) Code: EAR99; Halogen Free: Halogen Free; Thickness: 889µm; Voltage: 50V; Length: 1.6mm; Harmonized Tariff Schedule (HTS) Code: 8532.24.00.20; REACH SVHC: Unaffected; Introduction Date: 2005-08-18; Dielectric Material: Ceramic
D4 = CMP-004-00056-1: SMBJ5.0CA Series 600 W 5.0 V Surface Mount Bi-Directional TVS Diode - DO-214AA; Max Breakdown Voltage: 7.23V; Test Current: 10mA; Number of Channels: 1; Reverse Breakdown Voltage: 6.4V; Power Dissipation: 600W; Voltage Rating (DC): 5V; Breakdown Voltage: 6.8V; Max Output current: 65.2A; Clamping Voltage: 9.2V; Polarity: Bidirectional; Max Junction Temperature (Tj): 150°C; Max Reverse Leakage Current: 1.6mA; Value: 1nF; Max Power Dissipation: 5W; Element Configuration: Single; Schedule B: 8541100050, 8541100050; Packaging: Cut Tape; Mounting Technology: Surface Mount; Min Breakdown Voltage: 6.4V; Number of Elements: 1; Width: 3.9mm; Max Surge Current: 65.2A; Height: 2.5mm; Radiation Hardening: No; Length: 4.57mm; Pins: 2; RoHS: Compliant; Peak Pulse Power: 600W; Min Operating Temperature: -55°C; Case/Package: SMB; Number of Terminals: 2; Max Operating Temperature: 150°C; China RoHS: Non-Compliant; Leakage Current: 1.6mA; Reverse Standoff Voltage: 5V; Peak Pulse Current: 65.2A; REACH SVHC: Affected; Lead Free: Contains Lead; Termination: SMD/SMT; Lifecycle Status: Production; Direction: Bidirectional; Power Rating: 600W; Working Voltage: 5V
J2-J6 = CMP-002-00094-2: Large PCB pad
L1 = ASPI-0630LR-4R7M-T15: Inductor; Manufacturer_Name: ABRACON; Datasheet Link: https://abracon.com/Magnetics/power/ASPI-0630LR.pdf; Manufacturer_Part_Number: ASPI-0630LR-4R7M-T15; Mouser Part Number: 815-ASPI0630LR4R7T15; Mouser Price/Stock: https://www.mouser.co.uk/ProductDetail/ABRACON/ASPI-0630LR-4R7M-T15?qs=bWAYEm3xoCYVuRmkzS1c6A%3D%3D; Arrow Part Number: ASPI-0630LR-4R7M-T15; Arrow Price/Stock: https://www.arrow.com/en/products/aspi-0630lr-4r7m-t15/abracon?utm_currency=USD&region=nac

## Nets that join several sheets
1.5V: Analog frontend (8 pins), Digital circuit (R16.1), Right leg drive (IC4.3 R19.2 R20.2)
3.3V: Analog frontend (7 pins), Digital circuit (6 pins), Power supply (C18.2 U3.1), Right leg drive (6 pins)
+5: Digital circuit (C15.1 C16.2 R14.1 U6.7), Power supply (C17.2 U3.4 U3.6), Connectors (C22.2 D4.2 L1.1)
GND: Analog frontend (15 pins), Digital circuit (11 pins), Power supply (C17.1 C18.1 U3.5 U3.7), Right leg drive (7 pins), Connectors (5 pins)
NetC5_1: Analog frontend (C5.1 IC1.1 R8.2), Digital circuit (R15.1)
NetC7_2: Analog frontend (C7.2 D1.2 R4.1), Connectors (J4.1)
NetC8_2: Analog frontend (C8.2 D2.2 R5.1), Connectors (J5.1)
NetC21_1: Right leg drive (C21.1 D3.2 R25.1 R26.1), Connectors (J6.1)
NetIC2_3: Analog frontend (R7.1), Right leg drive (IC2.3)
NetIC3_3: Analog frontend (R6.1), Right leg drive (IC3.3)